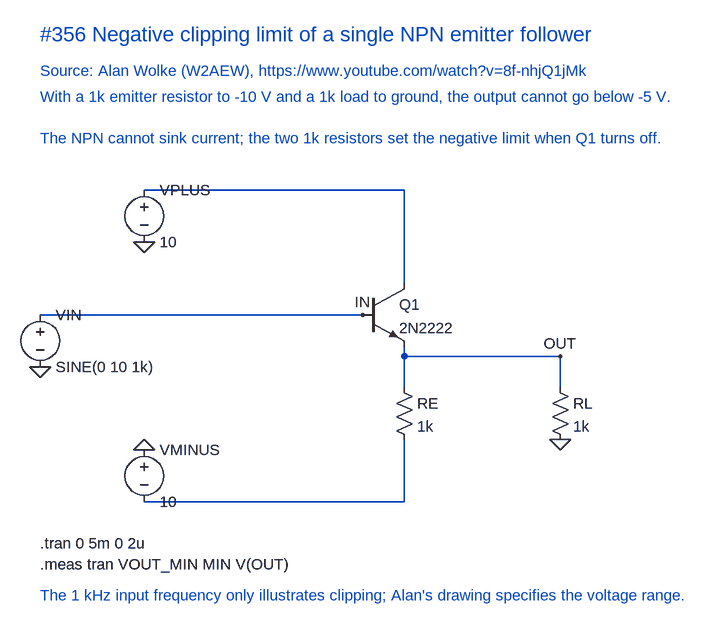
[diagram p0: schematic Negative clipping limit.asc]
Negative clipping limit.asc, the LTspice schematic file:
Version 4
SHEET 1 1100 900
WIRE 640 176 240 176
WIRE 640 320 640 176
WIRE 576 368 80 368
WIRE 640 432 640 416
WIRE 880 432 640 432
WIRE 640 480 640 432
WIRE 880 480 880 432
WIRE 640 656 240 656
WIRE 640 656 640 560
FLAG 240 256 0
FLAG 240 576 0
FLAG 80 448 0
FLAG 880 560 0
FLAG 576 368 IN
FLAG 880 432 OUT
SYMBOL voltage 240 160 R0
SYMATTR InstName VPLUS
SYMATTR Value 10
SYMBOL voltage 240 560 R0
SYMATTR InstName VMINUS
SYMATTR Value 10
SYMBOL voltage 80 352 R0
SYMATTR InstName VIN
SYMATTR Value SINE(0 10 1k)
SYMBOL npn 576 320 R0
SYMATTR InstName Q1
SYMATTR Value 2N2222
SYMBOL res 624 464 R0
SYMATTR InstName RE
SYMATTR Value 1k
SYMBOL res 864 464 R0
SYMATTR InstName RL
SYMATTR Value 1k
TEXT 80 -64 Left 3 ;#356 Negative clipping limit of a single NPN emitter follower
TEXT 80 -8 Left 2 ;Source: Alan Wolke (W2AEW), https://www.youtube.com/watch?v=8f-nhjQ1jMk
TEXT 80 32 Left 2 ;With a 1k emitter resistor to -10 V and a 1k load to ground, the output cannot go below -5 V.
TEXT 80 96 Left 2 ;The NPN cannot sink current; the two 1k resistors set the negative limit when Q1 turns off.
TEXT 80 720 Left 2 !.tran 0 5m 0 2u
TEXT 80 752 Left 2 !.meas tran VOUT_MIN MIN V(OUT)
TEXT 80 800 Left 2 ;The 1 kHz input frequency only illustrates clipping; Alan's drawing specifies the voltage range.

The netlist it stands for:
* Negative clipping limit.asc
VPLUS N001 0 10
VMINUS 0 N002 10
VIN IN 0 SINE(0 10 1k)
Q1 N001 IN OUT 0 2N2222
RE OUT N002 1k
RL OUT 0 1k
.model NPN NPN
.model PNP PNP
.lib standard.bjt
* #356 Negative clipping limit of a single NPN emitter follower
* Source: Alan Wolke (W2AEW), https://www.youtube.com/watch?v=8f-nhjQ1jMk
* With a 1k emitter resistor to -10 V and a 1k load to ground, the output cannot go below -5 V.
* The NPN cannot sink current; the two 1k resistors set the negative limit when Q1 turns off.
.tran 0 5m 0 2u
.meas tran VOUT_MIN MIN V(OUT)
* The 1 kHz input frequency only illustrates clipping; Alan's drawing specifies the voltage range.
.backanno
.end